# EAGLE schematic Dev_Board_Schematic (EAGLE 9.7.0)
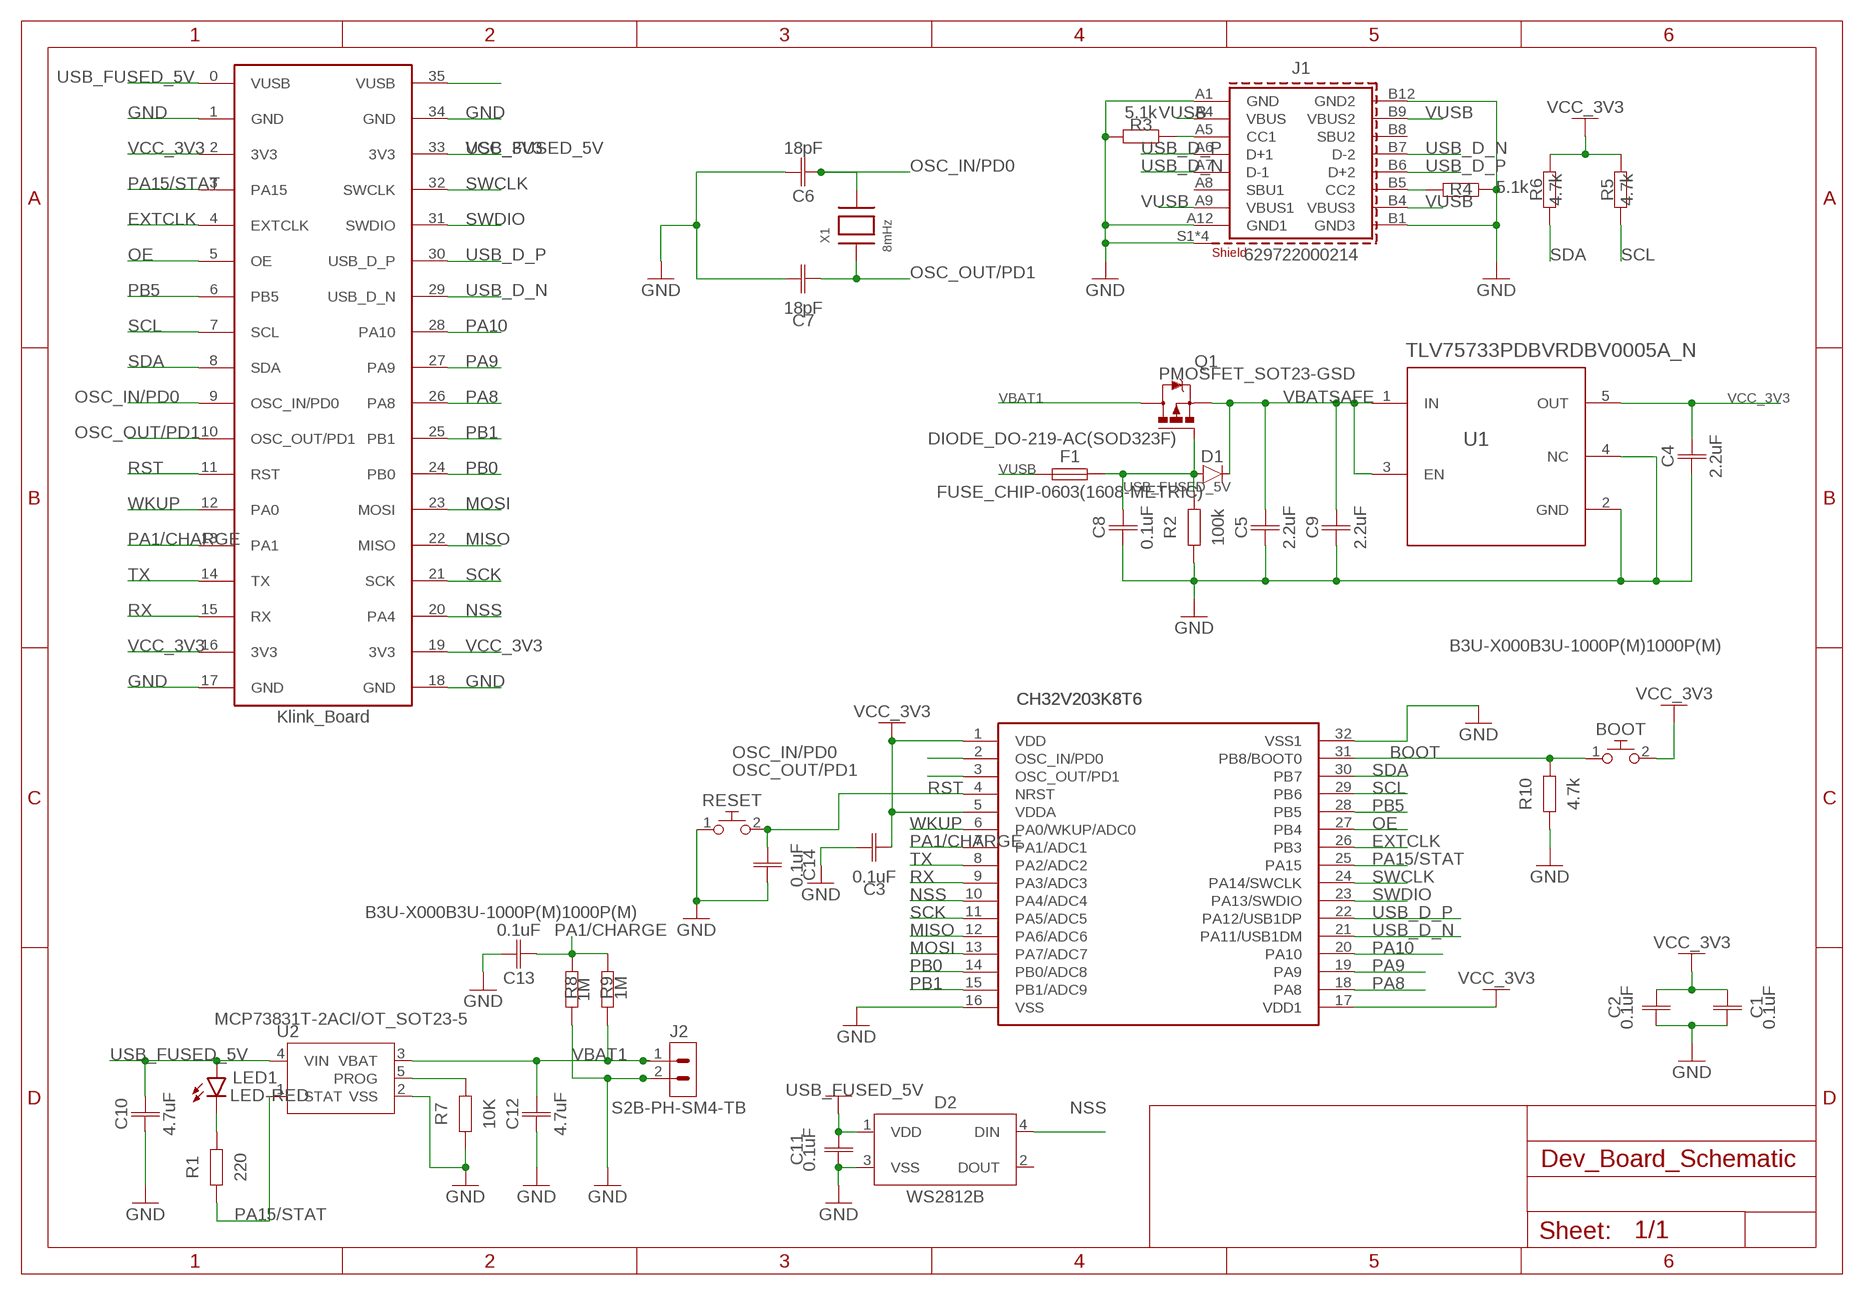
[diagram p0: schematic, sheet 1]

## Parts
BOOT  B3U-X000B3U-1000P(M)1000P(M)  [B3U-1000P(M)]
C1  0.1uF  C_CHIP-0603(1608-METRIC)  [CAPC1608X85]
C2  0.1uF  C_CHIP-0603(1608-METRIC)  [CAPC1608X85]
C3  0.1uF  C_CHIP-0603(1608-METRIC)  [CAPC1608X85]
C4  2.2uF  C_CHIP-0603(1608-METRIC)  [CAPC1608X85]
C5  2.2uF  C_CHIP-0603(1608-METRIC)  [CAPC1608X85]
C6  18pF  C_CHIP-0603(1608-METRIC)  [CAPC1608X85]
C7  18pF  C_CHIP-0603(1608-METRIC)  [CAPC1608X85]
C8  0.1uF  C_CHIP-0603(1608-METRIC)  [CAPC1608X85]
C9  2.2uF  C_CHIP-0603(1608-METRIC)  [CAPC1608X85]
C10  4.7uF  C_CHIP-0603(1608-METRIC)  [CAPC1608X85]
C11  0.1uF  C_CHIP-0603(1608-METRIC)  [CAPC1608X85]
C12  4.7uF  C_CHIP-0603(1608-METRIC)  [CAPC1608X85]
C13  0.1uF  C_CHIP-0603(1608-METRIC)  [CAPC1608X85]
C14  0.1uF  C_CHIP-0603(1608-METRIC)  [CAPC1608X85]
D1  DIODE_DO-219-AC(SOD323F)  [SODFL2513X70]
D2  WS2812B  [WS2812B]
F1  FUSE_CHIP-0603(1608-METRIC)  [FUSC1608X60N]
IC1  CH32V203K8T6LQFP32  [LQFP32-7X7]
J1  629722000214  [629722000214]
J2  S2B-PH-SM4-TB  [S2B-PH-SM4-TB]
LED1  LED-RED  LED_CHIP_RED-1608  [LEDC1608X39N_R]
Q1  PMOSFET_SOT23-GSD  [SOT23]
R1  220  R_CHIP-0603(1608-METRIC)  [RESC1608X60]
R2  100k  R_CHIP-0603(1608-METRIC)  [RESC1608X60]
R3  5.1k  R_CHIP-0603(1608-METRIC)  [RESC1608X60]
R4  5.1k  R_CHIP-0603(1608-METRIC)  [RESC1608X60]
R5  4.7k  R_CHIP-0603(1608-METRIC)  [RESC1608X60]
R6  4.7k  R_CHIP-0603(1608-METRIC)  [RESC1608X60]
R7  10K  R_CHIP-0603(1608-METRIC)  [RESC1608X60]
R8  1M  R_CHIP-0603(1608-METRIC)  [RESC1608X60]
R9  1M  R_CHIP-0603(1608-METRIC)  [RESC1608X60]
R10  4.7k  R_CHIP-0603(1608-METRIC)  [RESC1608X60]
RESET  B3U-X000B3U-1000P(M)1000P(M)  [B3U-1000P(M)]
U1  TLV75733PDBVRDBV0005A_N  TLV75733PDBVRSOT-23  [SOT-23-5]
U2  MCP73831T-2ACI/OT_SOT23-5  [SOT95P280X110-5]
U$1  KLINK_BAORDHYBRID_THROUGH_HOLE  [HYBRID_THROUGH_HOLE]
X1  8mHz  XTALNX5032  [NX5032]

## Nets
BOOT: BOOT.1 IC1.31(PB8/BOOT0) R10.2
EXTCLK: IC1.26(PB3) U$1.4(EXTCLK)
GND [POWER]: C1.1 C2.1 C3.2 C4.1 C5.1 C6.2 C7.2 C8.1 C9.1 C10.2 C11.1 C12.2 C13.1 C14.2 D2.3(VSS) IC1.16(VSS) IC1.32(VSS1) J1.A1(GND) J1.A12(GND1) J1.B1(GND3) J1.B12(GND2) J1.S1(SHIELD) J1.S2(SHIELD) J1.S3(SHIELD) J1.S4(SHIELD) J2.2 R2.1 R3.2 R4.1 R7.1 R8.1 R10.1 RESET.1 U1.2(GND) U1.4(NC) U2.2(VSS) U$1.1(GND) U$1.17(GND) U$1.18(GND) U$1.34(GND)
MISO: IC1.12(PA6/ADC6) U$1.22(MISO)
MOSI: IC1.13(PA7/ADC7) U$1.23(MOSI)
N$1: J1.B5(CC2) R4.2
N$2: J1.A5(CC1) R3.1
N$19: LED1.1(C) R1.2
NSS: D2.4(DIN) IC1.10(PA4/ADC4) U$1.20(PA4)
OE: IC1.27(PB4) U$1.5(OE)
OSC_IN/PD0: C6.1 IC1.2(OSC_IN/PD0) U$1.9(OSC_IN/PD0) X1.P$2
OSC_OUT/PD1: C7.1 IC1.3(OSC_OUT/PD1) U$1.10(OSC_OUT/PD1) X1.P$1
PA1/CHARGE: C13.2 IC1.7(PA1/ADC1) R8.2 R9.2 U$1.13(PA1)
PA8: IC1.18(PA8) U$1.26(PA8)
PA9: IC1.19(PA9) U$1.27(PA9)
PA10: IC1.20(PA10) U$1.28(PA10)
PA15/STAT: IC1.25(PA15) R1.1 U2.1(STAT) U$1.3(PA15)
PB0: IC1.14(PB0/ADC8) U$1.24(PB0)
PB1: IC1.15(PB1/ADC9) U$1.25(PB1)
PB5: IC1.28(PB5) U$1.6(PB5)
PROG: R7.2 U2.5(PROG)
RST: C14.1 IC1.4(NRST) RESET.2 U$1.11(RST)
RX: IC1.9(PA3/ADC3) U$1.15(RX)
SCK: IC1.11(PA5/ADC5) U$1.21(SCK)
SCL: IC1.29(PB6) R5.1 U$1.7(SCL)
SDA: IC1.30(PB7) R6.1 U$1.8(SDA)
SWCLK: IC1.24(PA14/SWCLK) U$1.32(SWCLK)
SWDIO: IC1.23(PA13/SWDIO) U$1.31(SWDIO)
TX: IC1.8(PA2/ADC2) U$1.14(TX)
USB_D_N: IC1.21(PA11/USB1DM) J1.A7(D-1) J1.B7(D-2) U$1.29(USB_D_N)
USB_D_P: IC1.22(PA12/USB1DP) J1.A6(D+1) J1.B6(D+2) U$1.30(USB_D_P)
USB_FUSED_5V [POWER]: C8.2 C10.1 C11.2 D1.2(A) D2.1(VDD) F1.2 LED1.2(A) Q1.1(G) R2.2 U2.4(VIN) U$1.0(VUSB) U$1.35(VUSB) ; supply symbol labelled VCC_3V3
VBAT1 [POWER]: C12.1 J2.1 Q1.3(D) R9.1 U2.3(VBAT)
VBATSAFE [POWER]: C5.2 C9.2 D1.1(C) Q1.2(S) U1.1(IN) U1.3(EN)
VCC_3V3 [POWER]: BOOT.2 C1.2 C2.2 C3.1 C4.2 IC1.1(VDD) IC1.5(VDDA) IC1.17(VDD1) R5.2 R6.2 U1.5(OUT) U$1.2(3V3) U$1.16(3V3) U$1.19(3V3) U$1.33(3V3)
VUSB [POWER]: F1.1 J1.A4(VBUS) J1.A9(VBUS1) J1.B4(VBUS3) J1.B9(VBUS2)
WKUP: IC1.6(PA0/WKUP/ADC0) U$1.12(PA0)
Unconnected: D2.2(DOUT) J1.A8(SBU1) J1.B8(SBU2)

## Notes on the sheet
- CH32V203K8T6 | CH32V203K8T6

## Library data of the parts
BOOT RESET = Switch:B3U-X000: Ultra-small Tactile Switch Contact form : SPST-NO Reference: Datasheet <https://omronfs.omron.com/en_US/ecb/products/pdf/en-b3u.pdf>; CATEGORY: Switches; DATASHEET: https://omronfs.omron.com/en_US/ecb/products/pdf/en-b3u.pdf; DESCRIPTION: Tactile Switch SPST-NO Top Actuated Surface Mount; MANUFACTURER: Omron Electronics Inc-EMC Div; MPN: B3U-1000PM; OPERATING_TEMPERATURE: -25°C ~ 70°C; PACKAGE_SIZE: NA; PACKAGE_TYPE: SMD; PART_STATUS: ACTIVE; ROHS: COMPLIANT; SERIES: B3U; SUBCATEGORY: Tactile Switches; TYPE: SPST-NO
C1-C14 = Capacitor:C: Capacitor - Generic; CATEGORY: Capacitor; PACKAGE_SIZE: 0603; PACKAGE_TYPE: Surface Mount; SUBCATEGORY: Ceramic Capacitors; TYPE: MLCC
D1 = Diode:DIODE: Diode Rectifier - Generic; CATEGORY: Diode; DESCRIPTION: Generic diode Surface Mount DO-219-AC(SOD323F); PACKAGE_SIZE: SOD323F; PACKAGE_TYPE: Surface Mount; SUBCATEGORY: Rectifiers
D2 = LED:WS2812B: Intelligent control LED integrated light source Datasheet <https://cdn-shop.adafruit.com/datasheets/WS2812B.pdf>; CATEGORY: LED; COLOR: RGB; DATASHEET: https://cdn-shop.adafruit.com/datasheets/WS2812B.pdf; DESCRIPTION: RGB LED chip 5050 Package; MANUFACTURER: Worldsemi; MPN: WS2812B; OPERATING_TEMPERATURE: -55°C ~ 150°C; PACKAGE_SIZE: 5050; PACKAGE_TYPE: Surface Mount; PART_STATUS: Active; ROHS: Compliant; SERIES: WS2812B; SUBCATEGORY: Chip LED Addressable; TYPE: Square with Flat Top
F1 = Circuit-Protection:FUSE: Fuse - Generic; CATEGORY_L1: Circuit Protection; CATEGORY_L2: Fuses; CATEGORY_L3: Board Mount (Cartridge Style Excluded); PACKAGE: Surface Mount; PACKAGE_SIZE: 0603
IC1 = WCH CH32V203:CH32V203K8T6
J1 = Wurth_Connectors_WR-USB:629722000214: WR-USB Type C Connectors Characteristics Available in 24p (3.x), 16p (2.0) and 6p (Power Delivery only) Aligned with Power Delivery up to 240W High durability (10 000 cycles) UL, TID listing for USB standards Applications Mobile computing and smart devices High-performance industrial and medical systems Consumer electronics and multimedia hubs Smart buildings Details see: www.we-online.com/en/components/products/INPUT_OUTPUT_WR_USB_STANDARD Updated by Ella 2026-07-03 2026 (C) Würth Elektronik; APPLICATION: USB 2.0; DATASHEET: https://www.we-online.com/redexpert/spec/629722000214?ae; GERDER: Receptacle; INTERFACE-TYPE: Type C; IR: 5 A; MOUNT: SMT; PACKAGING: Tape and Reel; PART-NUMBER: 629722000214; PCB-THICKNESS: 0.8 mm; PINS: 16pcs; TYPE: Horizontal; WORKING-VOLTAGE: 48 V (DC)
J2 = Connector:S2B-PH: Connector Header; CATEGORY_L1: Connectors; CATEGORY_L3: Right Angle; DATASHEET: https://www.jst-mfg.com/product/pdf/eng/ePH.pdf; DESCRIPTION: Connector Header Surface Mount Right Angle 2 position 0.079" (2.00mm); MANUFACTURER: JST Sales America Inc.; MPN: S2B-PH-SM4-TB; OPERATING_TEMPERATURE: -25°C ~ 85°C; PACKAGE: Surface Mount; PACKAGE_SIZE: NA; PART_STATUS: Active; PITCH: 0.079" (2.00mm); ROHS: Compliant; SERIES: PH
LED1 = Tutorial - Fusion 360:LED_CHIP: LED - Generic; CATEGORY: Opto-Electronic; COLOR: Red; SUB-CATEGORY: LED
Q1 = Transistor:PMOSFET: P-Channel MOSFET - Generic; CATEGORY: Transistor; DATASHEET: https://www.analog.com/media/en/package-pcb-resources/package/pkg_pdf/ltc-legacy-sot-23/sot3%2005-08-1631%20rev%20d.pdf; DESCRIPTION: Generic P-Channel MOSFET Surface Mount SOT23 Package; PACKAGE_SIZE: SOT23; PACKAGE_TYPE: Surface Mount; SUBCATEGORY: MOSFET; TYPE: P-Channel
R1-R10 = Resistor:R: Resistor Fixed - Generic; CATEGORY: Resistors; DESCRIPTION: Chip Resistor 1.60 X 0.82 X 0.60 mm body 0603(1608-METRIC) Package; PACKAGE_SIZE: 0603; PACKAGE_TYPE: Surface Mount
U1 = 2026-07-09_23-18-33_Library:TLV75733PDBVR; DATASHEET: https://www.ti.com/lit/gpn/tlv757p; TYPE: TYPE
U2 = IC_Power-Management:MCP73831*: Miniature single cell fully integrated Li-Ion Li-polymer charge management controller Reference: Datasheet <http://ww1.microchip.com/downloads/en/DeviceDoc/21984a.pdf> IC-09995; CATEGORY_L1: Power Management IC; CATEGORY_L2: Battery Chargers; CATEGORY_L3: Lithium Ion/Polymer; DATASHEET: https://ww1.microchip.com/downloads/en/DeviceDoc/MCP73831-Family-Data-Sheet-DS20001984H.pdf; DESCRIPTION: Charger IC Lithium Ion/Polymer SOT-23-5; INPUT_VOLTAGE: 6V; MANUFACTURER: Microchip Technology; MPN: MCP73831T-2ACI/OT; OPERATING_TEMPERATURE: -40°C ~ 85°C; OUTPUT_CURRENT: 500mA; OUTPUT_VOLTAGE: 4.2V; PACKAGE: Surface Mount; PACKAGE_SIZE: SOT-23-5; PART_STATUS: Active; ROHS: Compliant; SERIES: MCP73831; THERMALLOSS: 1.54 W; TOPOLOGY: NA
U$1 = Klink Board:KLINK_BAORD
X1 = adafruit:XTAL: Low cost SMT crystals, no capacitors included http://www.ladyada.net/library/eagle